# Altium schematic sheet Top_Sheet.SchDoc
size A; SheetNumber: 1; SheetTotal: 3
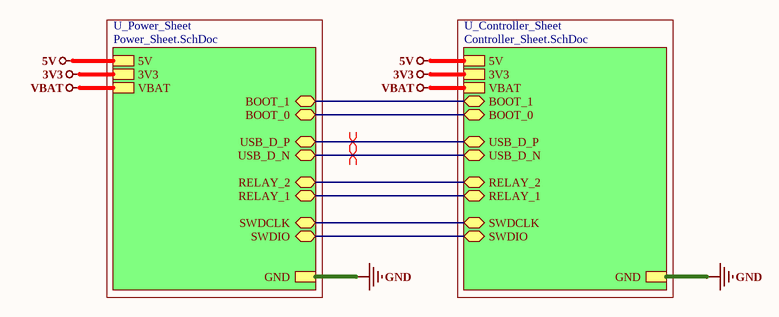
[diagram p0: Top_Sheet.SchDoc]

## Sub-sheets
U_Controller_Sheet = Controller_Sheet.SchDoc: BOOT_1 (bidir), BOOT_0 (bidir), USB_D_P (bidir), USB_D_N (bidir), RELAY_2 (bidir), RELAY_1 (bidir), SWDCLK (bidir), SWDIO (bidir), 3V3, GND, 5V, VBAT
U_Power_Sheet = Power_Sheet.SchDoc: 3V3, GND, BOOT_1 (bidir), BOOT_0 (bidir), USB_D_P (bidir), USB_D_N (bidir), RELAY_2 (bidir), RELAY_1 (bidir), SWDCLK (bidir), SWDIO (bidir), 5V, VBAT

## Nets
3V3: sheet U_Controller_Sheet/3V3, sheet U_Power_Sheet/3V3
5V: sheet U_Controller_Sheet/5V, sheet U_Power_Sheet/5V
GND: sheet U_Controller_Sheet/GND, sheet U_Power_Sheet/GND
VBAT: sheet U_Controller_Sheet/VBAT, sheet U_Power_Sheet/VBAT
(unnamed): sheet U_Controller_Sheet/BOOT_1, sheet U_Power_Sheet/BOOT_1
(unnamed): sheet U_Controller_Sheet/BOOT_0, sheet U_Power_Sheet/BOOT_0
(unnamed): sheet U_Controller_Sheet/USB_D_P, sheet U_Power_Sheet/USB_D_P
(unnamed): sheet U_Controller_Sheet/USB_D_N, sheet U_Power_Sheet/USB_D_N
(unnamed): sheet U_Controller_Sheet/RELAY_2, sheet U_Power_Sheet/RELAY_2
(unnamed): sheet U_Controller_Sheet/RELAY_1, sheet U_Power_Sheet/RELAY_1
(unnamed): sheet U_Controller_Sheet/SWDCLK, sheet U_Power_Sheet/SWDCLK
(unnamed): sheet U_Controller_Sheet/SWDIO, sheet U_Power_Sheet/SWDIO

## Layout directives
differential pair; net class USB; differential pair class USB_Lines; rule Impedance Constraint [Min = 85.00    Max = 90.00    ]; rule Matched Net Lengths [Tolerance = 50mil]: (no net found under the mark)